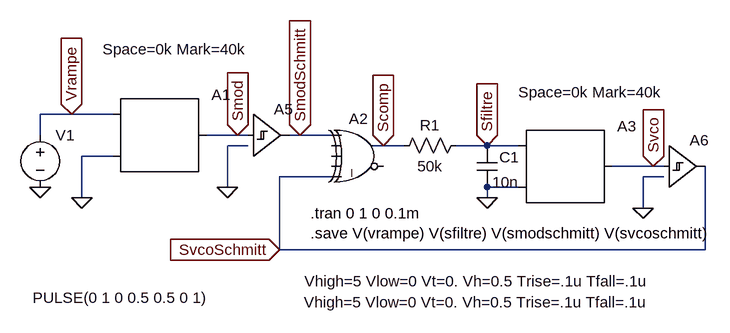
[diagram p0: schematic B_rampe_R50k.asc]
B_rampe_R50k.asc, the LTspice schematic file:
Version 4.1
SHEET 1 1356 680
WIRE -112 48 -160 48
WIRE -48 48 -112 48
WIRE -160 80 -160 48
WIRE 144 80 96 80
WIRE 160 80 144 80
WIRE 240 80 224 80
WIRE 288 80 240 80
WIRE 160 96 128 96
WIRE 368 96 352 96
WIRE 400 96 368 96
WIRE 528 96 480 96
WIRE 576 96 528 96
WIRE -48 112 -96 112
WIRE 784 128 720 128
WIRE 800 128 784 128
WIRE 288 144 208 144
WIRE 800 144 768 144
WIRE 128 160 128 96
WIRE 576 160 528 160
WIRE -96 176 -96 112
WIRE 528 176 528 160
WIRE 768 192 768 144
WIRE 208 256 208 144
WIRE 864 256 864 128
WIRE 864 256 208 256
FLAG 528 176 0
FLAG -160 160 0
FLAG -96 176 0
FLAG -112 48 Vrampe
IOPIN -112 48 In
FLAG 528 96 Sfiltre
IOPIN 528 96 In
FLAG 128 160 0
FLAG 368 96 Scomp
IOPIN 368 96 In
FLAG 144 80 Smod
IOPIN 144 80 In
FLAG 784 128 Svco
IOPIN 784 128 In
FLAG 768 192 0
FLAG 240 80 SmodSchmitt
IOPIN 240 80 In
FLAG 208 256 SvcoSchmitt
IOPIN 208 256 In
SYMBOL SpecialFunctions\\modulate -48 48 R0
WINDOW 3 -16 -100 Left 2
SYMATTR Value Space=0k Mark=40k
SYMATTR InstName A1
SYMBOL res 496 80 R90
WINDOW 0 0 56 VBottom 2
WINDOW 3 32 56 VTop 2
SYMATTR InstName R1
SYMATTR Value 50k
SYMBOL cap 512 96 R0
WINDOW 0 35 18 Left 2
SYMATTR InstName C1
SYMATTR Value 10n
SYMBOL Digital\\xor 336 48 R0
WINDOW 0 -21 7 Left 2
SYMATTR InstName A2
SYMBOL SpecialFunctions\\modulate 576 96 R0
WINDOW 3 0 -82 Left 2
SYMATTR Value Space=0k Mark=40k
SYMATTR InstName A3
SYMBOL Digital\\schmtbuf 800 64 R0
WINDOW 3 -553 241 Left 2
SYMATTR Value Vhigh=5 Vlow=0 Vt=0. Vh=0.5 Trise=.1u Tfall=.1u
SYMATTR InstName A6
SYMBOL voltage -160 64 R0
WINDOW 3 -12 266 Left 2
WINDOW 123 0 0 Left 0
WINDOW 39 0 0 Left 0
SYMATTR Value PULSE(0 1 0 0.5 0.5 0 1)
SYMATTR InstName V1
SYMBOL Digital\\schmtbuf 160 16 R0
WINDOW 3 86 321 Left 2
SYMATTR Value Vhigh=5 Vlow=0 Vt=0. Vh=0.5 Trise=.1u Tfall=.1u
SYMATTR InstName A5
TEXT 256 200 Left 2 !.tran 0 1 0 0.1m\n.save V(vrampe) V(sfiltre) V(smodschmitt) V(svcoschmitt)

The netlist it stands for:
* B_rampe_R50k.asc
A1 Vrampe 0 0 0 0 0 Smod 0 MODULATOR Space=0k Mark=40k
R1 Sfiltre Scomp 50k
C1 Sfiltre 0 10n
A2 SmodSchmitt 0 0 0 SvcoSchmitt 0 Scomp 0 XOR
A3 Sfiltre 0 0 0 0 0 Svco 0 MODULATOR Space=0k Mark=40k
A6 Svco 0 0 0 0 0 SvcoSchmitt 0 SCHMITT Vhigh=5 Vlow=0 Vt=0. Vh=0.5 Trise=.1u Tfall=.1u
V1 Vrampe 0 PULSE(0 1 0 0.5 0.5 0 1)
A5 Smod 0 0 0 0 0 SmodSchmitt 0 SCHMITT Vhigh=5 Vlow=0 Vt=0. Vh=0.5 Trise=.1u Tfall=.1u
.tran 0 1 0 0.1m
.save V(vrampe) V(sfiltre) V(smodschmitt) V(svcoschmitt)
.backanno
.end